# Altium project TYPEC_4KTransmitter-v1.0.PrjPcb (part 8 of 11)

## Sheet DRAM_LPDDR4_SHEET.SchDoc
size 420 x 297 mm; SheetNumber: 18; SheetTotal: 23
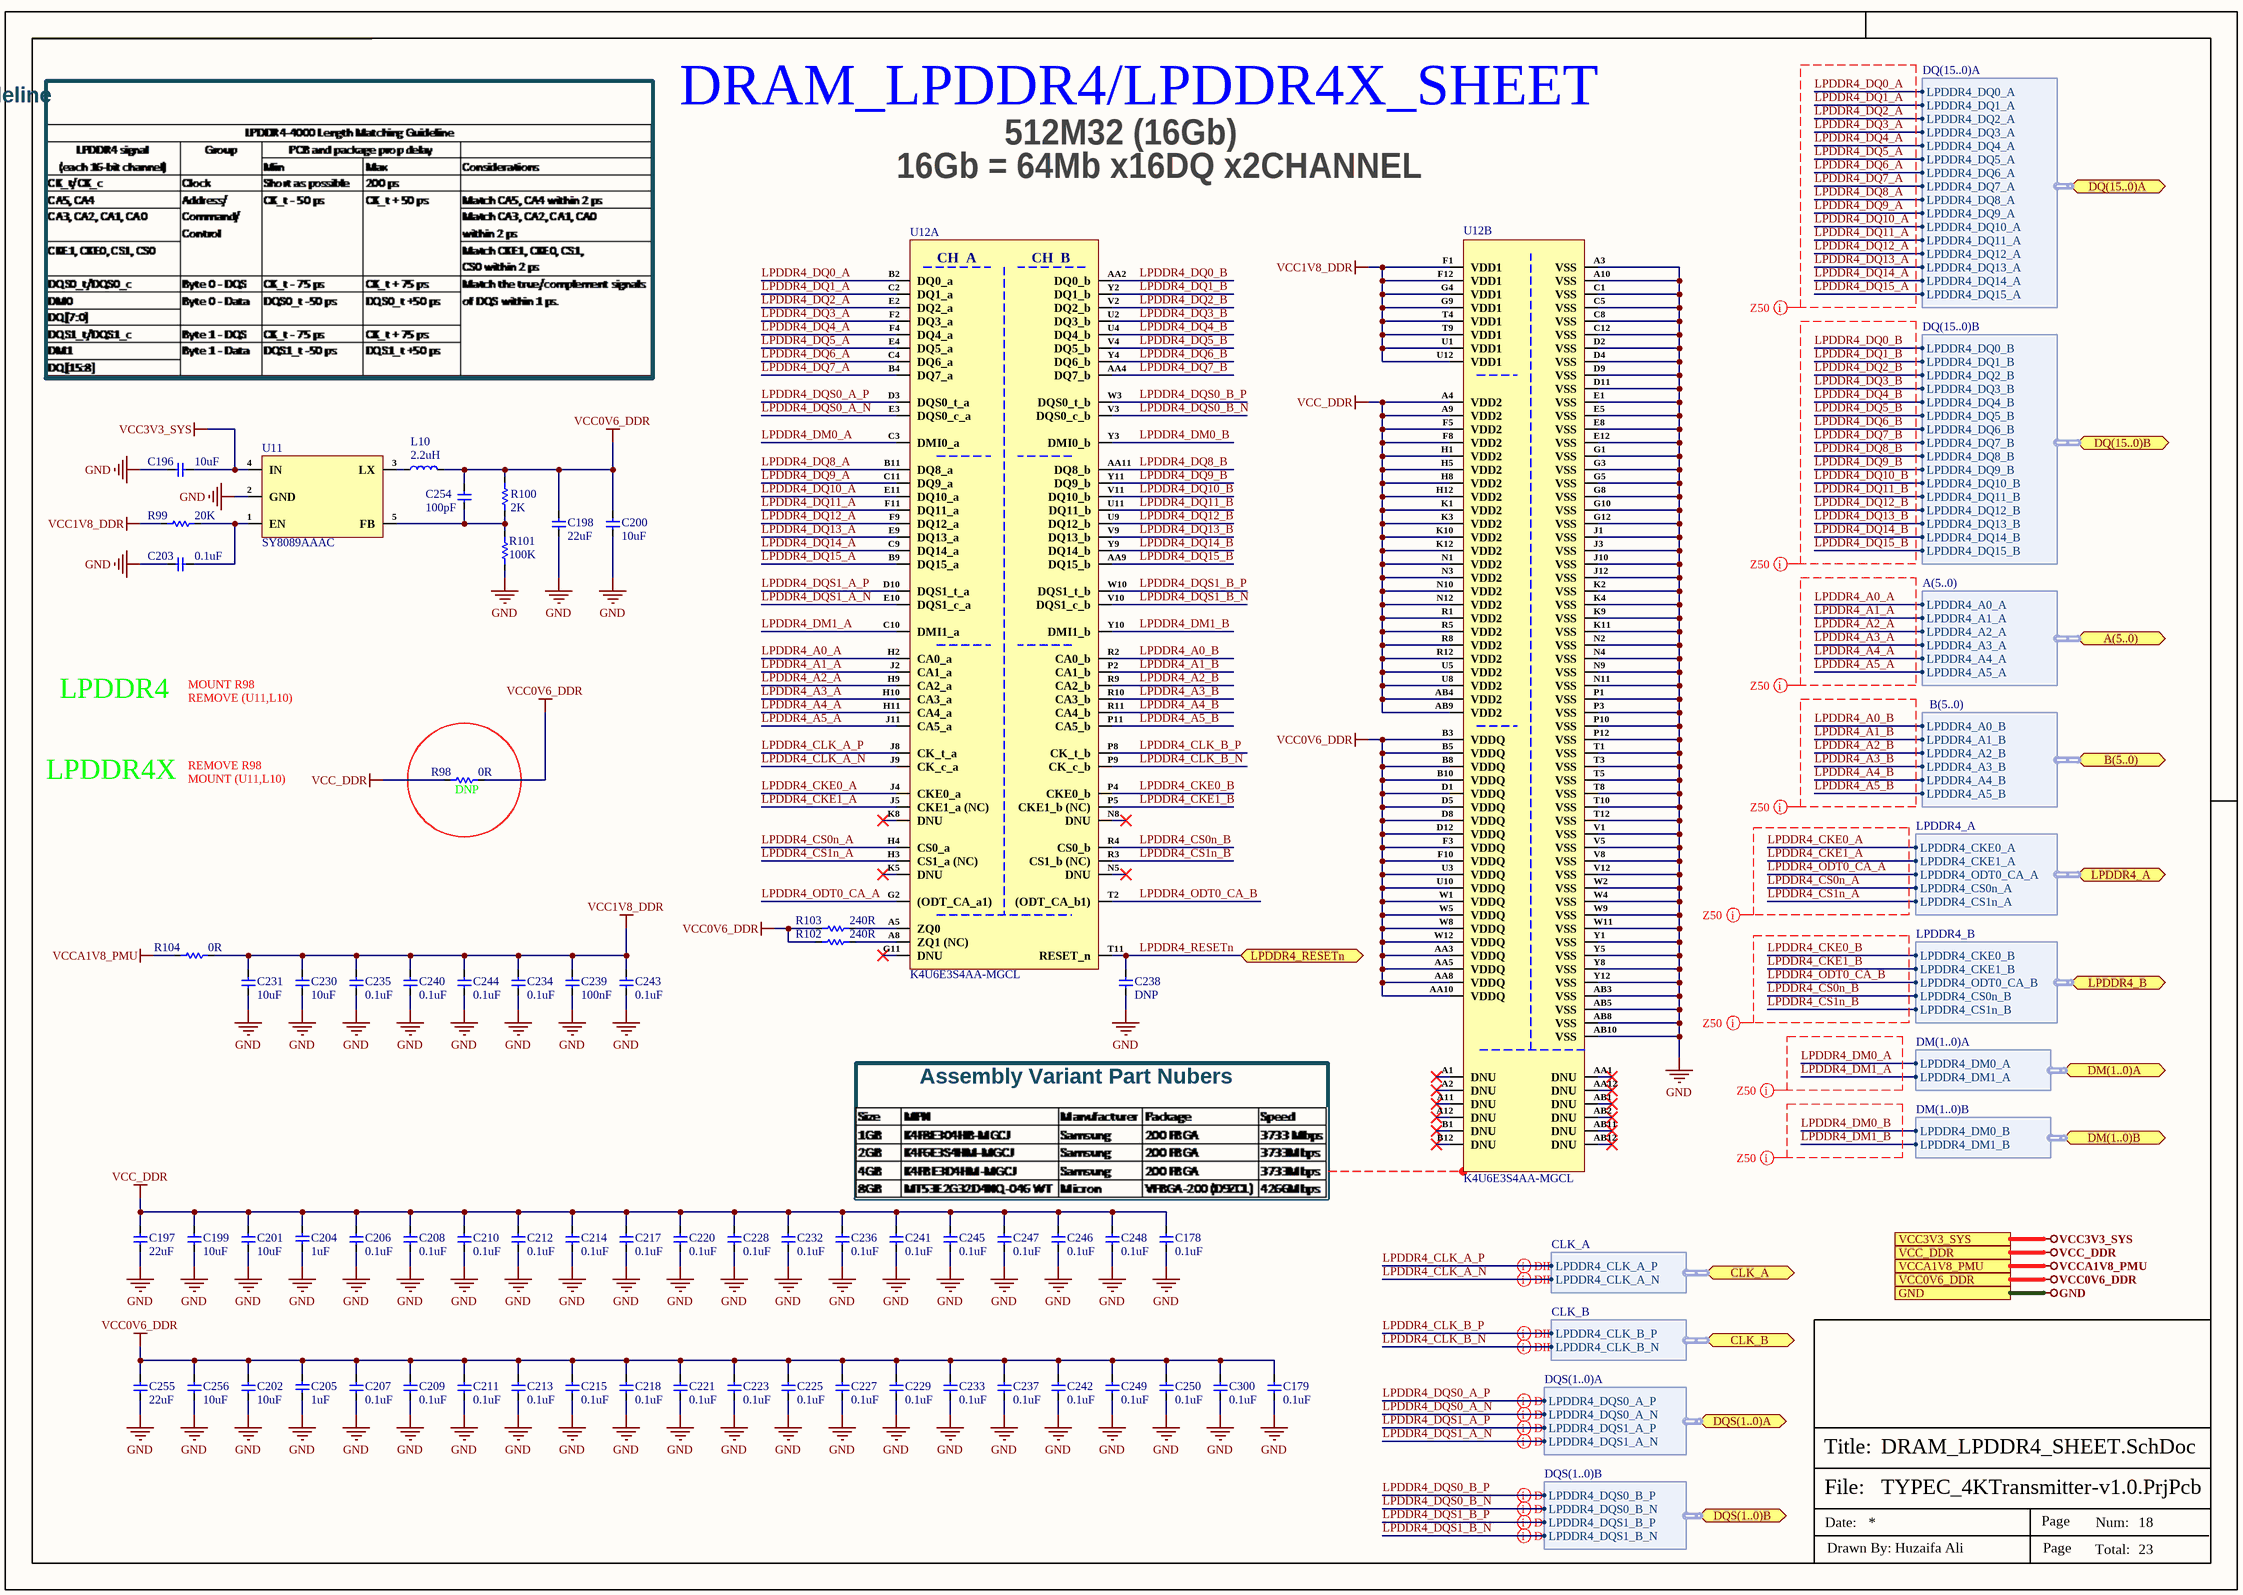
[diagram p18: DRAM_LPDDR4_SHEET.SchDoc]

### Parts
C178  0.1uF  [Cap-0402]
C179  0.1uF  [Cap-0402]
C196  10uF  [Cap-0603]
C197  22uF  [Cap-0603]
C198  22uF  [Cap-0603]
C199  10uF  [Cap-0603]
C200  10uF  [Cap-0603]
C201  10uF  [Cap-0603]
C202  10uF  [Cap-0402]
C203  0.1uF  [Cap-0402]
C204  1uF  [Cap-0402]
C205  1uF  [Cap-0402]
C206  0.1uF  [Cap-0402]
C207  0.1uF  [Cap-0402]
C208  0.1uF  [Cap-0402]
C209  0.1uF  [Cap-0402]
C210  0.1uF  [Cap-0402]
C211  0.1uF  [Cap-0402]
C212  0.1uF  [Cap-0402]
C213  0.1uF  [Cap-0402]
C214  0.1uF  [Cap-0402]
C215  0.1uF  [Cap-0402]
C217  0.1uF  [Cap-0402]
C218  0.1uF  [Cap-0402]
C220  0.1uF  [Cap-0402]
C221  0.1uF  [Cap-0402]
C223  0.1uF  [Cap-0402]
C225  0.1uF  [Cap-0402]
C227  0.1uF  [Cap-0402]
C228  0.1uF  [Cap-0402]
C229  0.1uF  [Cap-0402]
C230  10uF  [Cap-0603]
C231  10uF  [Cap-0603]
C232  0.1uF  [Cap-0402]
C233  0.1uF  [Cap-0402]
C234  0.1uF  [Cap-0402]
C235  0.1uF  [Cap-0402]
C236  0.1uF  [Cap-0402]
C237  0.1uF  [Cap-0402]
C238  DNP  [Cap-0402]
C239  100nF  [CAP-0201]
C240  0.1uF  [Cap-0402]
C241  0.1uF  [Cap-0402]
C242  0.1uF  [Cap-0402]
C243  0.1uF  [Cap-0402]
C244  0.1uF  [Cap-0402]
C245  0.1uF  [Cap-0402]
C246  0.1uF  [Cap-0402]
C247  0.1uF  [Cap-0402]
C248  0.1uF  [Cap-0402]
C249  0.1uF  [Cap-0402]
C250  0.1uF  [Cap-0402]
C254  100pF  [Cap-0402]
C255  22uF  [Cap-0603]
C256  10uF  [Cap-0402]
C300  0.1uF  [Cap-0402]
L10  2.2uH  [WPN4020H2R2MT_]
R98  DNP  [Res-0603]
R99  20K  [Res-0402]
R100  2K  [Res-0402]
R101  100K  [Res-0402]
R102  240R  [Res-0402]
R103  240R  [Res-0402]
R104  0R  [Res-0603]
U11  SY8089AAAC  [SOT-23-5]
U12  K4U6E3S4AA-MGCL  [200-WFBGA (10x15)]  (parts A,B of 2)

### Ports
A(5..0) (bidir, harness A(5..0), see RK3566_DDR-PHY_SHEET[4D]), B(5..0) (bidir, harness B(5..0), see RK3566_DDR-PHY_SHEET[5D]), CLK_A (bidir, harness CLK_A, see RK3566_DDR-PHY_SHEET[4D]), CLK_B (bidir, harness CLK_B, see RK3566_DDR-PHY_SHEET[5D]), DM(1..0)A (bidir, harness DM(1..0)A, see RK3566_DDR-PHY_SHEET[1C]), DM(1..0)B (bidir, harness DM(1..0)B, see RK3566_DDR-PHY_SHEET[3C]), DQ(15..0)A (bidir, harness DQ(15..0)A, see RK3566_DDR-PHY_SHEET[1D]), DQ(15..0)B (bidir, harness DQ(15..0)B, see RK3566_DDR-PHY_SHEET[3D]), DQS(1..0)A (bidir, harness DQS(1..0)A, see RK3566_DDR-PHY_SHEET[4D]), DQS(1..0)B (bidir, harness DQS(1..0)B, see RK3566_DDR-PHY_SHEET[5D]), GND (see eMMC_SPI-FLASH_SHEET[1D], HDMI2.0_SHEET[3D], POWER_LDO_SHEET[3D], POWER_OTHER_SHEET[3C], POWER_PMIC_RK809_CODEC[3C], POWER_PMIC_RK809_DC DC[3D], POWER_PMIC_RK809_LDO[4C], POWER_PMIC_RK809_MGM[3D], RK3566_AUDIO_SHEET[3C], RK3566_DDR-PHY_SHEET[5D], RK3566_FLASH-SD_SHEET[4C], RK3566_OSC_PMUIO_SHEET[5D], RK3566_POWER_SHEET[3D], RK3566_SARADC_GPIO[3D], RK3566_USB_PCIe_SHEET[3D], RK3566_VI_SHEET[3D], RK3566_VO_SHEET_1[3C], RK3566_VO_SHEET_2[4C], TYPE-C_INTERFACE_SHEET[3D], TYPE-C_TO_MIPI-CSI_SHEET[5D], USB2.0_SHEET[3D], WIFI-6_SHEET[3D]), LPDDR4_A (bidir, harness LPDDR4_A, see RK3566_DDR-PHY_SHEET[4D]), LPDDR4_B (bidir, harness LPDDR4_B, see RK3566_DDR-PHY_SHEET[5D]), LPDDR4_RESETn (bidir, see RK3566_DDR-PHY_SHEET[5B]), VCC0V6_DDR (see RK3566_DDR-PHY_SHEET[5D]), VCC3V3_SYS (see POWER_LDO_SHEET[3D], POWER_OTHER_SHEET[3C], POWER_PMIC_RK809_DC DC[3D], POWER_PMIC_RK809_LDO[4C], POWER_PMIC_RK809_MGM[3D], RK3566_SARADC_GPIO[3D], TYPE-C_TO_MIPI-CSI_SHEET[5D], WIFI-6_SHEET[3D]), VCC_DDR (see POWER_PMIC_RK809_DC DC[3D], RK3566_DDR-PHY_SHEET[5D]), VCCA1V8_PMU (see POWER_PMIC_RK809_LDO[4C], RK3566_OSC_PMUIO_SHEET[5D])

### Harnesses
DQ(15..0)A: LPDDR4_DQ0_A, LPDDR4_DQ1_A, LPDDR4_DQ2_A, LPDDR4_DQ3_A, LPDDR4_DQ4_A, LPDDR4_DQ5_A, LPDDR4_DQ6_A, LPDDR4_DQ7_A, LPDDR4_DQ8_A, LPDDR4_DQ9_A, LPDDR4_DQ10_A, LPDDR4_DQ11_A, LPDDR4_DQ12_A, LPDDR4_DQ13_A, LPDDR4_DQ14_A, LPDDR4_DQ15_A
DQ(15..0)B: LPDDR4_DQ0_B, LPDDR4_DQ1_B, LPDDR4_DQ2_B, LPDDR4_DQ3_B, LPDDR4_DQ4_B, LPDDR4_DQ5_B, LPDDR4_DQ6_B, LPDDR4_DQ7_B, LPDDR4_DQ8_B, LPDDR4_DQ9_B, LPDDR4_DQ10_B, LPDDR4_DQ11_B, LPDDR4_DQ12_B, LPDDR4_DQ13_B, LPDDR4_DQ14_B, LPDDR4_DQ15_B
DM(1..0)A: LPDDR4_DM0_A, LPDDR4_DM1_A
DM(1..0)B: LPDDR4_DM0_B, LPDDR4_DM1_B
DQS(1..0)A: LPDDR4_DQS0_A_P, LPDDR4_DQS0_A_N, LPDDR4_DQS1_A_P, LPDDR4_DQS1_A_N
DQS(1..0)B: LPDDR4_DQS0_B_P, LPDDR4_DQS0_B_N, LPDDR4_DQS1_B_P, LPDDR4_DQS1_B_N
CLK_B: LPDDR4_CLK_B_P, LPDDR4_CLK_B_N
CLK_A: LPDDR4_CLK_A_P, LPDDR4_CLK_A_N
A(5..0): LPDDR4_A3_A, LPDDR4_A5_A, LPDDR4_A1_A, LPDDR4_A0_A, LPDDR4_A2_A, LPDDR4_A4_A
B(5..0): LPDDR4_A3_B, LPDDR4_A5_B, LPDDR4_A1_B, LPDDR4_A0_B, LPDDR4_A2_B, LPDDR4_A4_B
LPDDR4_A: LPDDR4_CKE1_A, LPDDR4_ODT0_CA_A, LPDDR4_CKE0_A, LPDDR4_CS0n_A, LPDDR4_CS1n_A
LPDDR4_B: LPDDR4_ODT0_CA_B, LPDDR4_CKE0_B, LPDDR4_CKE1_B, LPDDR4_CS1n_B, LPDDR4_CS0n_B

### Nets
GND: C178.1 C179.1 C196.1 C197.1 C198.1 C199.1 C200.1 C201.1 C202.1 C203.1 C204.2 C205.2 C206.1 C207.1 C208.1 C209.1 C210.1 C211.1 C212.1 C213.1 C214.1 C215.1 C217.1 C218.1 C220.1 C221.1 C223.1 C225.1 C227.1 C228.1 C229.1 C230.1 C231.1 C232.1 C233.1 C234.1 C235.1 C236.1 C237.1 C238.1 C239.1 C240.1 C241.1 C242.1 C243.1 C244.1 C245.1 C246.1 C247.1 C248.1 C249.1 C250.1 C255.1 C256.1 C300.1 R101.1 U11.2(GND) U12.A3(VSS) U12.A10(VSS) U12.AB3(VSS) U12.AB5(VSS) U12.AB8(VSS) U12.AB10(VSS) U12.C1(VSS) U12.C5(VSS) U12.C8(VSS) U12.C12(VSS) U12.D2(VSS) U12.D4(VSS) U12.D9(VSS) U12.D11(VSS) U12.E1(VSS) U12.E5(VSS) U12.E8(VSS) U12.E12(VSS) U12.G1(VSS) U12.G3(VSS) U12.G5(VSS) U12.G8(VSS) U12.G10(VSS) U12.G12(VSS) U12.J1(VSS) U12.J3(VSS) U12.J10(VSS) U12.J12(VSS) U12.K2(VSS) U12.K4(VSS) U12.K9(VSS) U12.K11(VSS) U12.N2(VSS) U12.N4(VSS) U12.N9(VSS) U12.N11(VSS) U12.P1(VSS) U12.P3(VSS) U12.P10(VSS) U12.P12(VSS) U12.T1(VSS) U12.T3(VSS) U12.T5(VSS) U12.T8(VSS) U12.T10(VSS) U12.T12(VSS) U12.V1(VSS) U12.V5(VSS) U12.V8(VSS) U12.V12(VSS) U12.W2(VSS) U12.W4(VSS) U12.W9(VSS) U12.W11(VSS) U12.Y1(VSS) U12.Y5(VSS) U12.Y8(VSS) U12.Y12(VSS) ; port GND
VCC0V6_DDR: C179.2 C198.2 C200.2 C202.2 C205.1 C207.2 C209.2 C211.2 C213.2 C215.2 C218.2 C221.2 C223.2 C225.2 C227.2 C229.2 C233.2 C237.2 C242.2 C249.2 C250.2 C254.2 C255.2 C256.2 C300.2 L10.2 R98.1 R100.2 R102.2 R103.2 U12.AA3(VDDQ) U12.AA5(VDDQ) U12.AA8(VDDQ) U12.AA10(VDDQ) U12.B3(VDDQ) U12.B5(VDDQ) U12.B8(VDDQ) U12.B10(VDDQ) U12.D1(VDDQ) U12.D5(VDDQ) U12.D8(VDDQ) U12.D12(VDDQ) U12.F3(VDDQ) U12.F10(VDDQ) U12.U3(VDDQ) U12.U10(VDDQ) U12.W1(VDDQ) U12.W5(VDDQ) U12.W8(VDDQ) U12.W12(VDDQ) ; port VCC0V6_DDR
VCC1V8_DDR: C230.2 C231.2 C234.2 C235.2 C239.2 C240.2 C243.2 C244.2 R99.2 R104.2 U12.F1(VDD1) U12.F12(VDD1) U12.G4(VDD1) U12.G9(VDD1) U12.T4(VDD1) U12.T9(VDD1) U12.U1(VDD1) U12.U12(VDD1)
VCC3V3_SYS: C196.2 U11.4(IN) ; port VCC3V3_SYS
VCC_DDR: C178.2 C197.2 C199.2 C201.2 C204.1 C206.2 C208.2 C210.2 C212.2 C214.2 C217.2 C220.2 C228.2 C232.2 C236.2 C241.2 C245.2 C246.2 C247.2 C248.2 R98.2 U12.A4(VDD2) U12.A9(VDD2) U12.AB4(VDD2) U12.AB9(VDD2) U12.F5(VDD2) U12.F8(VDD2) U12.H1(VDD2) U12.H5(VDD2) U12.H8(VDD2) U12.H12(VDD2) U12.K1(VDD2) U12.K3(VDD2) U12.K10(VDD2) U12.K12(VDD2) U12.N1(VDD2) U12.N3(VDD2) U12.N10(VDD2) U12.N12(VDD2) U12.R1(VDD2) U12.R5(VDD2) U12.R8(VDD2) U12.R12(VDD2) U12.U5(VDD2) U12.U8(VDD2) ; port VCC_DDR
VCCA1V8_PMU: R104.1 ; port VCCA1V8_PMU
LPDDR4_A0_A: U12.H2(CA0_a) ; port A(5..0).LPDDR4_A0_A
LPDDR4_A0_B: U12.R2(CA0_b) ; port B(5..0).LPDDR4_A0_B
LPDDR4_A1_A: U12.J2(CA1_a) ; port A(5..0).LPDDR4_A1_A
LPDDR4_A1_B: U12.P2(CA1_b) ; port B(5..0).LPDDR4_A1_B
LPDDR4_A2_A: U12.H9(CA2_a) ; port A(5..0).LPDDR4_A2_A
LPDDR4_A2_B: U12.R9(CA2_b) ; port B(5..0).LPDDR4_A2_B
LPDDR4_A3_A: U12.H10(CA3_a) ; port A(5..0).LPDDR4_A3_A
LPDDR4_A3_B: U12.R10(CA3_b) ; port B(5..0).LPDDR4_A3_B
LPDDR4_A4_A: U12.H11(CA4_a) ; port A(5..0).LPDDR4_A4_A
LPDDR4_A4_B: U12.R11(CA4_b) ; port B(5..0).LPDDR4_A4_B
LPDDR4_A5_A: U12.J11(CA5_a) ; port A(5..0).LPDDR4_A5_A
LPDDR4_A5_B: U12.P11(CA5_b) ; port B(5..0).LPDDR4_A5_B
LPDDR4_CKE0_A: U12.J4(CKE0_a) ; port LPDDR4_A.LPDDR4_CKE0_A
LPDDR4_CKE0_B: U12.P4(CKE0_b) ; port LPDDR4_B.LPDDR4_CKE0_B
LPDDR4_CKE1_A: U12.J5(CKE1_a_(NC)) ; port LPDDR4_A.LPDDR4_CKE1_A
LPDDR4_CKE1_B: U12.P5(CKE1_b_(NC)) ; port LPDDR4_B.LPDDR4_CKE1_B
LPDDR4_CLK_A_N: U12.J9(CK_c_a) ; port CLK_A.LPDDR4_CLK_A_N
LPDDR4_CLK_A_P: U12.J8(CK_t_a) ; port CLK_A.LPDDR4_CLK_A_P
LPDDR4_CLK_B_N: U12.P9(CK_c_b) ; port CLK_B.LPDDR4_CLK_B_N
LPDDR4_CLK_B_P: U12.P8(CK_t_b) ; port CLK_B.LPDDR4_CLK_B_P
LPDDR4_CS0n_A: U12.H4(CS0_a) ; port LPDDR4_A.LPDDR4_CS0n_A
LPDDR4_CS0n_B: U12.R4(CS0_b) ; port LPDDR4_B.LPDDR4_CS0n_B
LPDDR4_CS1n_A: U12.H3(CS1_a_(NC)) ; port LPDDR4_A.LPDDR4_CS1n_A
LPDDR4_CS1n_B: U12.R3(CS1_b_(NC)) ; port LPDDR4_B.LPDDR4_CS1n_B
LPDDR4_DM0_A: U12.C3(DMI0_a) ; port DM(1..0)A.LPDDR4_DM0_A
LPDDR4_DM0_B: U12.Y3(DMI0_b) ; port DM(1..0)B.LPDDR4_DM0_B
LPDDR4_DM1_A: U12.C10(DMI1_a) ; port DM(1..0)A.LPDDR4_DM1_A
LPDDR4_DM1_B: U12.Y10(DMI1_b) ; port DM(1..0)B.LPDDR4_DM1_B
LPDDR4_DQ0_A: U12.B2(DQ0_a) ; port DQ(15..0)A.LPDDR4_DQ0_A
LPDDR4_DQ0_B: U12.AA2(DQ0_b) ; port DQ(15..0)B.LPDDR4_DQ0_B
LPDDR4_DQ1_A: U12.C2(DQ1_a) ; port DQ(15..0)A.LPDDR4_DQ1_A
LPDDR4_DQ1_B: U12.Y2(DQ1_b) ; port DQ(15..0)B.LPDDR4_DQ1_B
LPDDR4_DQ2_A: U12.E2(DQ2_a) ; port DQ(15..0)A.LPDDR4_DQ2_A
LPDDR4_DQ2_B: U12.V2(DQ2_b) ; port DQ(15..0)B.LPDDR4_DQ2_B
LPDDR4_DQ3_A: U12.F2(DQ3_a) ; port DQ(15..0)A.LPDDR4_DQ3_A
LPDDR4_DQ3_B: U12.U2(DQ3_b) ; port DQ(15..0)B.LPDDR4_DQ3_B
LPDDR4_DQ4_A: U12.F4(DQ4_a) ; port DQ(15..0)A.LPDDR4_DQ4_A
LPDDR4_DQ4_B: U12.U4(DQ4_b) ; port DQ(15..0)B.LPDDR4_DQ4_B
LPDDR4_DQ5_A: U12.E4(DQ5_a) ; port DQ(15..0)A.LPDDR4_DQ5_A
LPDDR4_DQ5_B: U12.V4(DQ5_b) ; port DQ(15..0)B.LPDDR4_DQ5_B
LPDDR4_DQ6_A: U12.C4(DQ6_a) ; port DQ(15..0)A.LPDDR4_DQ6_A
LPDDR4_DQ6_B: U12.Y4(DQ6_b) ; port DQ(15..0)B.LPDDR4_DQ6_B
LPDDR4_DQ7_A: U12.B4(DQ7_a) ; port DQ(15..0)A.LPDDR4_DQ7_A
LPDDR4_DQ7_B: U12.AA4(DQ7_b) ; port DQ(15..0)B.LPDDR4_DQ7_B
LPDDR4_DQ8_A: U12.B11(DQ8_a) ; port DQ(15..0)A.LPDDR4_DQ8_A
LPDDR4_DQ8_B: U12.AA11(DQ8_b) ; port DQ(15..0)B.LPDDR4_DQ8_B
LPDDR4_DQ9_A: U12.C11(DQ9_a) ; port DQ(15..0)A.LPDDR4_DQ9_A
LPDDR4_DQ9_B: U12.Y11(DQ9_b) ; port DQ(15..0)B.LPDDR4_DQ9_B
LPDDR4_DQ10_A: U12.E11(DQ10_a) ; port DQ(15..0)A.LPDDR4_DQ10_A
LPDDR4_DQ10_B: U12.V11(DQ10_b) ; port DQ(15..0)B.LPDDR4_DQ10_B
LPDDR4_DQ11_A: U12.F11(DQ11_a) ; port DQ(15..0)A.LPDDR4_DQ11_A
LPDDR4_DQ11_B: U12.U11(DQ11_b) ; port DQ(15..0)B.LPDDR4_DQ11_B
LPDDR4_DQ12_A: U12.F9(DQ12_a) ; port DQ(15..0)A.LPDDR4_DQ12_A
LPDDR4_DQ12_B: U12.U9(DQ12_b) ; port DQ(15..0)B.LPDDR4_DQ12_B
LPDDR4_DQ13_A: U12.E9(DQ13_a) ; port DQ(15..0)A.LPDDR4_DQ13_A
LPDDR4_DQ13_B: U12.V9(DQ13_b) ; port DQ(15..0)B.LPDDR4_DQ13_B
LPDDR4_DQ14_A: U12.C9(DQ14_a) ; port DQ(15..0)A.LPDDR4_DQ14_A
LPDDR4_DQ14_B: U12.Y9(DQ14_b) ; port DQ(15..0)B.LPDDR4_DQ14_B
LPDDR4_DQ15_A: U12.B9(DQ15_a) ; port DQ(15..0)A.LPDDR4_DQ15_A
LPDDR4_DQ15_B: U12.AA9(DQ15_b) ; port DQ(15..0)B.LPDDR4_DQ15_B
LPDDR4_DQS0_A_N: U12.E3(DQS0_c_a) ; port DQS(1..0)A.LPDDR4_DQS0_A_N
LPDDR4_DQS0_A_P: U12.D3(DQS0_t_a) ; port DQS(1..0)A.LPDDR4_DQS0_A_P
LPDDR4_DQS0_B_N: U12.V3(DQS0_c_b) ; port DQS(1..0)B.LPDDR4_DQS0_B_N
LPDDR4_DQS0_B_P: U12.W3(DQS0_t_b) ; port DQS(1..0)B.LPDDR4_DQS0_B_P
LPDDR4_DQS1_A_N: U12.E10(DQS1_c_a) ; port DQS(1..0)A.LPDDR4_DQS1_A_N
LPDDR4_DQS1_A_P: U12.D10(DQS1_t_a) ; port DQS(1..0)A.LPDDR4_DQS1_A_P
LPDDR4_DQS1_B_N: U12.V10(DQS1_c_b) ; port DQS(1..0)B.LPDDR4_DQS1_B_N
LPDDR4_DQS1_B_P: U12.W10(DQS1_t_b) ; port DQS(1..0)B.LPDDR4_DQS1_B_P
LPDDR4_ODT0_CA_A: U12.G2((ODT_CA_a1)) ; port LPDDR4_A.LPDDR4_ODT0_CA_A
LPDDR4_ODT0_CA_B: U12.T2((ODT_CA_b1)) ; port LPDDR4_B.LPDDR4_ODT0_CA_B
LPDDR4_RESETn: C238.2 U12.T11(RESET_n) ; port LPDDR4_RESETn
NetC203_2: C203.2 R99.1 U11.1(EN)
NetC254_1: C254.1 R100.1 R101.2 U11.5(FB)
NetL10_1: L10.1 U11.3(LX)
NetR102_1: R102.1 U12.A8(ZQ1_(NC))
NetR103_1: R103.1 U12.A5(ZQ0)

Not connected (* = marked no-connect by the designer): U12 A1(DNU)* A2(DNU)* A11(DNU)* A12(DNU)* AA1(DNU)* AA12(DNU)* AB1(DNU)* AB2(DNU)* AB11(DNU)* AB12(DNU)* B1(DNU)* B12(DNU)* G11(DNU)* K5(DNU)* K8(DNU)* N5(DNU)* N8(DNU)*

### Layout directives
net class 50OHM_DDR: LPDDR4_A0_A, LPDDR4_A0_B, LPDDR4_A1_A, LPDDR4_A1_B, LPDDR4_A2_A, LPDDR4_A2_B, LPDDR4_A3_A, LPDDR4_A3_B, LPDDR4_A4_A, LPDDR4_A4_B, LPDDR4_A5_A, LPDDR4_A5_B, LPDDR4_CKE0_A, LPDDR4_CKE0_B, LPDDR4_CKE1_A, LPDDR4_CKE1_B, LPDDR4_CS0n_A, LPDDR4_CS0n_B, LPDDR4_CS1n_A, LPDDR4_CS1n_B, LPDDR4_DM0_A, LPDDR4_DM0_B, LPDDR4_DM1_A, LPDDR4_DM1_B, LPDDR4_DQ0_A, LPDDR4_DQ0_B, LPDDR4_DQ1_A, LPDDR4_DQ1_B, LPDDR4_DQ2_A, LPDDR4_DQ2_B, LPDDR4_DQ3_A, LPDDR4_DQ3_B, LPDDR4_DQ4_A, LPDDR4_DQ4_B, LPDDR4_DQ5_A, LPDDR4_DQ5_B, LPDDR4_DQ6_A, LPDDR4_DQ6_B, LPDDR4_DQ7_A, LPDDR4_DQ7_B, LPDDR4_DQ8_A, LPDDR4_DQ8_B, LPDDR4_DQ9_A, LPDDR4_DQ9_B, LPDDR4_DQ10_A, LPDDR4_DQ10_B, LPDDR4_DQ11_A, LPDDR4_DQ11_B, LPDDR4_DQ12_A, LPDDR4_DQ12_B, LPDDR4_DQ13_A, LPDDR4_DQ13_B, LPDDR4_DQ14_A, LPDDR4_DQ14_B, LPDDR4_DQ15_A, LPDDR4_DQ15_B, LPDDR4_ODT0_CA_A, LPDDR4_ODT0_CA_B
differential pair; differential pair class 100OHM_DDR_DQS: LPDDR4_DQS0_A_N, LPDDR4_DQS0_A_P, LPDDR4_DQS0_B_N, LPDDR4_DQS0_B_P, LPDDR4_DQS1_A_N, LPDDR4_DQS1_A_P, LPDDR4_DQS1_B_N, LPDDR4_DQS1_B_P
differential pair; differential pair class 100OHM_DDR_CLK: LPDDR4_CLK_A_N, LPDDR4_CLK_A_P, LPDDR4_CLK_B_N, LPDDR4_CLK_B_P

### Notes on the sheet
- PCB Layout Length Matching Guideline
- 512M32 (16Gb)
- DRAM_LPDDR4/LPDDR4X_SHEET
- 16Gb = 64Mb x16DQ x2CHANNEL
- LPDDR4
- REMOVE (U11,L10)
- MOUNT R98
- LPDDR4X
- MOUNT (U11,L10)
- REMOVE R98
- (near R98) 0R
- Assembly Variant Part Nubers
- File:
- Title:
- Date:
- Page
- Num:
- Total:
- Drawn By: Huzaifa Ali
- (in symbol K4U6E3S4AA-MGCL, part A) CH  A; CH  B

### Library data of the parts
C178 C179 C203 C206-C215 C217 C218 C220 C221 C223 C225 C227-C229 C232-C237 C240-C250 C300 = CC0402KRX5R6BB104: CAP CER 0.1UF 10V X5R 0402; Manufacturer: Yageo; Capacitance: 100nF; Tolerance: 10%; Dissipation Factor: 5%; Insulation Resistance: 10GR; Item Type: Capacitor; Supplier 1: Digi-Key; Manufacturer Part Number: CC0402KRX5R6BB104; RoHS: Yes; Category: Ceramic Capacitors; Stock 1: 6385580; Pricing 1: 1=0.10000, 10=0.02700, 50=0.01500, 100=0.01220, 500=0.00874, 1000=0.00687, 2500=0.00625, 5000=0.00575 (USD); Mount: Surface Mount; Case/Package: 0402; Number of Pins: 2; Case Code (Imperial): 0402; Case Code (Metric): 1005; Min Operating Temperature: -55°C; Max Operating Temperature: 85°C; Dielectric: X5R; Packaging: Tape and Reel; Voltage Rating: 10V; Package Quantity: 1; Termination: SMD/SMT; Voltage Rating (DC): 10V; Series: CC; Length: 1mm; Width: 0.02inch; Height: 0.5mm; Depth: 0.5mm; Thickness: 0.022inch; Radiation Hardening: No; RoHS Compliant: Yes; REACH SVHC: No SVHC; Lead Free: Lead Free; Halogen Free: Halogen Free; ComponentLink1URL: https://datasheet.ciiva.com/144/mlccorderingcode-144029.pdf?src-supplier=Digi-Key; ComponentLink1Description: https://datasheet.ciiva.com/144/mlccorderingcode-144029.pdf?src-supplier=Digi-Key; ComponentLink2URL: https://datasheet.ciiva.com/144/mlccorderingcode-144028.pdf?src-supplier=Digi-Key; ComponentLink2Description: https://datasheet.ciiva.com/144/mlccorderingcode-144028.pdf?src-supplier=Digi-Key; ComponentLink3URL: https://datasheet.ciiva.com/144/mlccorderingcode-144030.pdf?src-supplier=Digi-Key; ComponentLink3Description: https://datasheet.ciiva.com/144/mlccorderingcode-144030.pdf?src-supplier=Digi-Key; ComponentLink4URL: https://datasheet.ciiva.com/7978/1359354-7978091.pdf?src-supplier=Element14; ComponentLink4Description: https://datasheet.ciiva.com/7978/1359354-7978091.pdf?src-supplier=Element14; ComponentLink5URL: https://datasheet.ciiva.com/11587/upy-gphc-x5r-4v-to-50v-12-11587302.pdf?src-supplier=Avnet; ComponentLink5Description: https://datasheet.ciiva.com/11587/upy-gphc-x5r-4v-to-50v-12-11587302.pdf?src-supplier=Avnet; Supplier Part Number 1: 311-1336-1-ND; LCSC Part Number: C129131
C196 C199-C201 C230 C231 = CC0603KRX5R6BB106: CAP CER 10UF 10V X5R 0603; Manufacturer: Yageo; Tolerance: 10%; Item Type: Capacitor; Supplier 1: Digi-Key; Manufacturer Part Number: CC0603KRX5R6BB106; RoHS: Yes; Category: Ceramic Capacitors; Stock 1: 187515; Pricing 1: 1=0.24000, 10=0.16300, 50=0.09780, 100=0.08260, 500=0.05654, 1000=0.05001 (USD); Mount: Surface Mount; Case/Package: 0603; Case Code (Metric): 1608; Case Code (Imperial): 0603; Weight: 7.1E-05oz; Min Operating Temperature: -55°C; Max Operating Temperature: 85°C; Capacitance: 10uF; Packaging: Tape and Reel; Dielectric: X5R; Voltage Rating: 10V; Termination: SMD/SMT; Resistor Type: Ceramic; Voltage Rating (DC): 10V; Package Quantity: 4000; Length: 0.063inch; Width: 0.031inch; Thickness: 0.035inch; Depth: 0.8mm; Lead Free: Lead Free; Halogen Free: Halogen Free; RoHS Compliant: Yes; ComponentLink1URL: http://www.mouser.com/ds/2/447/Yageo_UPY-GP_NP0_16V-to-50V_9-358835.pdf?src-supplier=Mouser; ComponentLink1Description: http://www.mouser.com/ds/2/447/Yageo_UPY-GP_NP0_16V-to-50V_9-358835.pdf?src-supplier=Mouser; ComponentLink2URL: http://www.yageo.com/documents/recent/UPY-GPHC_X5R_4V-to-50V_25.pdf?src-supplier=Digi-Key; ComponentLink2Description: http://www.yageo.com/documents/recent/UPY-GPHC_X5R_4V-to-50V_25.pdf?src-supplier=Digi-Key; Supplier Part Number 1: 311-1782-1-ND; LCSC Part Number: C326057
C197 C198 C255 = CC0603MRX5R6BB226: CAP CER 22UF 10V X5R 0603; Manufacturer: Yageo; Tolerance: 20%; Item Type: Capacitor; Supplier 1: Digi-Key; Manufacturer Part Number: CC0603MRX5R6BB226; RoHS: Yes; Category: Ceramic Capacitors; Stock 1: 19628; Pricing 1: 1=0.68000, 10=0.48000, 50=0.36300, 100=0.31610, 500=0.23416, 1000=0.19903 (USD); Mount: Surface Mount; Case/Package: 0603; Case Code (Metric): 1608; Case Code (Imperial): 0603; Weight: 7.1E-05oz; Min Operating Temperature: -55°C; Max Operating Temperature: 85°C; Capacitance: 22uF; Packaging: Tape and Reel; Dielectric: X5R; Voltage Rating: 10V; Termination: SMD/SMT; Voltage Rating (DC): 10V; Package Quantity: 4000; Length: 0.063inch; Width: 0.8mm; Thickness: 0.035inch; Lead Free: Lead Free; Halogen Free: Halogen Free; RoHS Compliant: Yes; ComponentLink1URL: http://www.mouser.com/ds/2/447/Yageo_UPY-GP_NP0_16V-to-50V_9-358835.pdf?src-supplier=Mouser; ComponentLink1Description: http://www.mouser.com/ds/2/447/Yageo_UPY-GP_NP0_16V-to-50V_9-358835.pdf?src-supplier=Mouser; ComponentLink2URL: http://www.yageo.com/documents/recent/UPY-GPHC_X5R_4V-to-50V_25.pdf?src-supplier=Digi-Key; ComponentLink2Description: http://www.yageo.com/documents/recent/UPY-GPHC_X5R_4V-to-50V_25.pdf?src-supplier=Digi-Key; Supplier Part Number 1: 311-1819-1-ND; LCSC Part Number: C109447; Height: 0.8mm
C202 C256 = CC0402MRX5R6BB106: CAP CER 10UF 10V X5R 0402; Manufacturer: Yageo; Tolerance: 20%; Item Type: Capacitor; Supplier 1: Future Electronics; Manufacturer Part Number: CC0402MRX5R6BB106; RoHS: Yes; Category: Ceramic Capacitors; Stock 1: 80000; Pricing 1: 10000=0.02650, 20000=0.02590, 30000=0.02550, 40000=0.02530, 50000=0.02450 (USD); Mount: Surface Mount; Case/Package: 0402; Case Code (Metric): 1005; Case Code (Imperial): 0402; Min Operating Temperature: -55°C; Max Operating Temperature: 85°C; Capacitance: 10uF; Packaging: Tape and Reel; Voltage Rating: 10V; RoHS Compliant: Yes; ComponentLink1URL: http://www.yageo.com/documents/recent/UPY-GPHC_X5R_4V-to-50V_25.pdf?src-supplier=Digi-Key; ComponentLink1Description: http://www.yageo.com/documents/recent/UPY-GPHC_X5R_4V-to-50V_25.pdf?src-supplier=Digi-Key; Supplier Part Number 1: 6097631; LCSC Part Number: C962143
C204 C205 = CC0402KRX5R6BB105: CAP CER 1UF 10V X5R 0402; Manufacturer: Yageo; Tolerance: 10%; Dissipation Factor: 15%; Item Type: Capacitor; Supplier 1: Mouser; Manufacturer Part Number: CC0402KRX5R6BB105; RoHS: Yes; Category: Ceramic Capacitors; Stock 1: 6711367; Pricing 1: 1=0.11000, 10=0.05500, 50=0.05500, 100=0.03300, 500=0.02700, 1000=0.02200, 2500=0.02100, 10000=0.01800 (USD); Mount: Surface Mount; Case/Package: 0402; Number of Pins: 2; Case Code (Metric): 1005; Case Code (Imperial): 0402; Min Operating Temperature: -55°C; Max Operating Temperature: 85°C; Capacitance: 1uF; Dielectric: X5R; Package Quantity: 1; Voltage Rating: 10V; Packaging: Tape and Reel; Voltage Rating (DC): 10V; Termination: SMD/SMT; Resistor Type: Ceramic; Series: CC; Construction: Flat; Length: 1mm; Width: 0.02inch; Height: 0.5mm; Thickness: 0.022inch; Depth: 0.5mm; Radiation Hardening: No; REACH SVHC: No SVHC; Lead Free: Lead Free; Halogen Free: Halogen Free; RoHS Compliant: Yes; ComponentLink1URL: https://datasheet.ciiva.com/176/upy-gphc-x5r-4v-to-50v-12-176704.pdf?src-supplier=Digi-Key; ComponentLink1Description: https://datasheet.ciiva.com/176/upy-gphc-x5r-4v-to-50v-12-176704.pdf?src-supplier=Digi-Key; ComponentLink2URL: https://datasheet.ciiva.com/176/mlccorderingcode-176705.pdf?src-supplier=Digi-Key; ComponentLink2Description: https://datasheet.ciiva.com/176/mlccorderingcode-176705.pdf?src-supplier=Digi-Key; ComponentLink3URL: https://datasheet.ciiva.com/176/mlccorderingcode-176706.pdf?src-supplier=Digi-Key; ComponentLink3Description: https://datasheet.ciiva.com/176/mlccorderingcode-176706.pdf?src-supplier=Digi-Key; Supplier Part Number 1: 603-CC402KRX5R6BB105; LCSC Part Number: C106254
C238 = GRM1555C1H102JA01D: CAP CER 1000PF 50V C0G/NP0 0402; Manufacturer: Murata; Material: Ceramic; Capacitance: 1nF; Tolerance: 5%; Dielectric: C0G; Insulation Resistance: 10GR; Temperature Coefficient: 30ppm/°C; Item Type: Capacitor; Supplier 1: Avnet; Manufacturer Part Number: GRM1555C1H102JA01D; RoHS: Yes; Category: Ceramic Capacitors; Stock 1: 800000; Pricing 1: 10000=0.00648, 20000=0.00613, 40000=0.00578, 60000=0.00543, 80000=0.00508, 100000=0.00473, 1000000=0.00438 (USD); Mount: Surface Mount; Case/Package: 0402; Number of Pins: 2; Case Code (Metric): 1005; Case Code (Imperial): 0402; Dielectric Material: Ceramic; Min Operating Temperature: -55°C; Max Operating Temperature: 125°C; Package Quantity: 1; Voltage Rating: 50V; Packaging: Tape and Reel; Voltage Rating (DC): 50V; Termination: SMD/SMT; Voltage: 50V; Series: GRM; Construction: Flat; Length: 1mm; Width: 0.5mm; Height: 0.5mm; Thickness: 0.022inch; Depth: 0.5mm; Size: 0.5mm; Radiation Hardening: No; Reach SVHC Compliant: Yes; Lead Free: Lead Free; RoHS Compliant: Yes; ComponentLink1URL: https://datasheet.ciiva.com/34302/1855908-34302849.pdf?src-supplier=Jameco; ComponentLink1Description: https://datasheet.ciiva.com/34302/1855908-34302849.pdf?src-supplier=Jameco; ComponentLink2URL: https://datasheet.ciiva.com/132/product-132800.pdf?src-supplier=Digi-Key; ComponentLink2Description: https://datasheet.ciiva.com/132/product-132800.pdf?src-supplier=Digi-Key; ComponentLink3URL: https://datasheet.ciiva.com/132/grm1555c1h102ja01-01-132799.pdf?src-supplier=Digi-Key; ComponentLink3Description: https://datasheet.ciiva.com/132/grm1555c1h102ja01-01-132799.pdf?src-supplier=Digi-Key; ComponentLink4URL: https://datasheet.ciiva.com/11786/0900766b807a1cab-11786727.pdf?src-supplier=RSComponents; ComponentLink4Description: https://datasheet.ciiva.com/11786/0900766b807a1cab-11786727.pdf?src-supplier=RSComponents; ComponentLink5URL: https://datasheet.ciiva.com/29200/453569-da-01-en-vs-kondensator-0402-29200121.pdf?src-supplier=Conrad; ComponentLink5Description: https://datasheet.ciiva.com/29200/453569-da-01-en-vs-kondensator-0402-29200121.pdf?src-supplier=Conrad; ComponentLink6URL: https://datasheet.ciiva.com/7828/4360-7828821.pdf?src-supplier=Element14; ComponentLink6Description: https://datasheet.ciiva.com/7828/4360-7828821.pdf?src-supplier=Element14; ComponentLink7URL: https://datasheet.ciiva.com/14116/grmseries-tc-hitype-eng-14116919.pdf?src-supplier=Distrelec; ComponentLink7Description: https://datasheet.ciiva.com/14116/grmseries-tc-hitype-eng-14116919.pdf?src-supplier=Distrelec; ComponentLink8URL: https://datasheet.ciiva.com/14116/grmseries-tc-hitype-eng-14116858.pdf?src-supplier=Distrelec; ComponentLink8Description: https://datasheet.ciiva.com/14116/grmseries-tc-hitype-eng-14116858.pdf?src-supplier=Distrelec; ComponentLink9URL: https://datasheet.ciiva.com/132/grm1555c1h102ja01-01-132801.pdf?src-supplier=Digi-Key; ComponentLink9Description: https://datasheet.ciiva.com/132/grm1555c1h102ja01-01-132801.pdf?src-supplier=Digi-Key; ComponentLink10URL: https://datasheet.ciiva.com/7828/1747436-7828822.pdf?src-supplier=Element14; ComponentLink10Description: https://datasheet.ciiva.com/7828/1747436-7828822.pdf?src-supplier=Element14; Supplier Part Number 1: GRM1555C1H102JA01D; LCSC Part Number: C76947
C239 = CC0201KRX5R6BB104: as C151 on sheet RK3566_VO_SHEET_2; Supplier 1: Mouser; Manufacturer Part Number: CC0201KRX5R6BB104; RoHS: Yes; Category: Ceramic Capacitors; Stock 1: 824403; Pricing 1: 1=0.10000, 10=0.02400, 50=0.02400, 100=0.01900, 1000=0.01100, 10000=0.00900 (USD); Mount: Surface Mount; Case/Package: 0201; Case Code (Imperial): 0201; Case Code (Metric): 0603; Min Operating Temperature: -55°C; Max Operating Temperature: 85°C; Capacitance: 100nF; Dielectric: X5R; Packaging: Tape and Reel; Voltage Rating: 10V; Termination: SMD/SMT; Voltage Rating (DC): 10V; Series: CC; Length: 0.6mm; Width: 0.012inch; Height: 0.3mm; Depth: 0.3mm; Thickness: 0.013inch; Radiation Hardening: No; RoHS Compliant: Yes; Lead Free: Lead Free; Halogen Free: Halogen Free; ComponentLink1URL: https://datasheet.ciiva.com/11587/upy-gphc-x5r-4v-to-50v-12-11587190.pdf?src-supplier=Avnet; ComponentLink1Description: https://datasheet.ciiva.com/11587/upy-gphc-x5r-4v-to-50v-12-11587190.pdf?src-supplier=Avnet; Supplier Part Number 1: 603-CC201KRX5R6BB104; LCSC Part Number: C190183; Weight: 6E-06oz; Resistor Type: Ceramic; Construction: Flat
C254 = GRM1555C1H101JA01D: CAP CER 100PF 50V C0G/NP0 0402; Manufacturer: Murata; Material: Ceramic; Dielectric: C0G; Tolerance: 5%; Supplier 1: Mouser; Manufacturer Part Number: GRM1555C1H101JA01D; RoHS: Yes; Category: Ceramic Capacitors; Stock 1: 2073105; Pricing 1: 1=0.10000, 10=0.01000, 50=0.01000, 100=0.00900, 500=0.00600, 1000=0.00500, 2500=0.00400, 10000=0.00300, 50000=0.00200 (USD); Mount: Surface Mount; Case/Package: 0402; Case Code (Metric): 1005; Case Code (Imperial): 0402; Min Operating Temperature: -55°C; Max Operating Temperature: 125°C; Voltage Rating: 50V; Capacitance: 100pF; Packaging: Tape and Reel; Package Quantity: 1; Voltage Rating (DC): 50V; Termination: SMD/SMT; Series: GRM; Construction: Flat; Voltage: 50V; Length: 1mm; Width: 0.02inch; Height: 0.5mm; Thickness: 0.022inch; Depth: 0.5mm; Radiation Hardening: No; REACH SVHC: No SVHC; Lead Free: Lead Free; RoHS Compliant: Yes; ComponentLink1URL: https://datasheet.ciiva.com/11786/0900766b80ef921d-11786069.pdf?src-supplier=RSComponents; ComponentLink1Description: https://datasheet.ciiva.com/11786/0900766b80ef921d-11786069.pdf?src-supplier=RSComponents; ComponentLink2URL: https://datasheet.ciiva.com/18184/getdatasheetpartid-199957-18184175.pdf?src-supplier=Verical; ComponentLink2Description: https://datasheet.ciiva.com/18184/getdatasheetpartid-199957-18184175.pdf?src-supplier=Verical; ComponentLink3URL: https://datasheet.ciiva.com/29200/453557-da-01-en-vs-kondensator-0402-29200111.pdf?src-supplier=Conrad; ComponentLink3Description: https://datasheet.ciiva.com/29200/453557-da-01-en-vs-kondensator-0402-29200111.pdf?src-supplier=Conrad; ComponentLink4URL: https://datasheet.ciiva.com/6271/partnumbering-e-01-6271071.pdf?src-supplier=Digi-Key; ComponentLink4Description: https://datasheet.ciiva.com/6271/partnumbering-e-01-6271071.pdf?src-supplier=Digi-Key; ComponentLink5URL: https://datasheet.ciiva.com/16440/product-16440566.pdf?src-supplier=Future+Electronics; ComponentLink5Description: https://datasheet.ciiva.com/16440/product-16440566.pdf?src-supplier=Future+Electronics; Supplier Part Number 1: 81-GRM1555C1H101JA1D; LCSC Part Number: C77177
L10 = WPN4020H2R2MT: Fixed Ind 2.2UH 4.3A 48MOHM SMD; Manufacturer: Sunlord; Item Type: Inductor; Manufacturer Part Number: WPN4020H2R2MT; LCSC Part Number: C98361; ComponentLink1Description: LCSC; ComponentLink1URL: https://www.lcsc.com/product-detail/Power-Inductors_Sunlord-WPN4020H2R2MT_C98361.html; Supplier 1: Digi-Key; RoHS: No; Stock 1: 1762; Pricing 1: 1=0.84000, 10=0.73500, 25=0.68240, 50=0.57760, 100=0.52500, 250=0.49352, 500=0.44100, 1000=0.35700 (USD); Supplier Part Number 1: 3442-WPN4020H2R2MTCT-ND
R98 = RC0603JR-070RL: RES 0 OHM JUMPER 1/10W 0603; Manufacturer: Yageo; Item Type: Resistor; Resistance: 0mR; Tolerance: 1%; Power Rating: 100mW; Voltage Rating: 50V; Temperature Coefficient: 200ppm/°C; Resistance Tolerance: 5%; Supplier 1: Digi-Key; Manufacturer Part Number: RC0603JR-070RL; RoHS: Yes; Stock 1: 18081776; Pricing 1: 1=0.10000, 10=0.01700, 25=0.01240, 50=0.00960, 100=0.00700, 250=0.00536, 500=0.00430, 1000=0.00316 (USD); Case/Package: 0603; Contact Plating: Tin,Matte; Case Code (Imperial): 0603; Case Code (Metric): 1608; Size Code: 0603; Min Operating Temperature: -55°C; Max Operating Temperature: 155°C; Resistor Type: Thick Film; Packaging: Tape and Reel; Termination: SMD/SMT; Features: Moisture Resistant; Series: RC; Max Power Dissipation: 100mW; Number of Terminations: 2; Length: 1.6mm; Width: 0.8mm; Height: 0.45mm; Radiation Hardening: No; Lead Free: Lead Free; RoHS Compliant: Yes; Supplier Part Number 1: 311-0.0GRCT-ND; LCSC Part Number: C95177; Category: Chip SMD Resistors; Number of Pins: 2; Voltage Rating (DC): 50V; Technology: THICK FILM; Package Quantity: 5000; Construction: Rectangular; Depth: 0.8mm; Reach SVHC Compliant: No SVHC; Military Standard: Not
R99 = RC0402FR-0720KL: RES 20K OHM 1% 1/16W 0402; Manufacturer: Yageo; Resistance: 20kR; Temperature Coefficient: 100ppm/°C; Power Rating: 62.5mW; Voltage Rating: 50V; Max Power Dissipation: 63mW; Item Type: Resistor; Supplier 1: Avnet; Manufacturer Part Number: RC0402FR-0720KL; RoHS: Yes; Category: Chip SMD Resistors; Stock 1: 1960708; Pricing 1: 10000=0.00085 (USD); Case/Package: 0402; Case Code (Metric): 1005; Case Code (Imperial): 0402; Min Operating Temperature: -55°C; Max Operating Temperature: 155°C; Resistor Type: Thick Film; Tolerance: 1%; Packaging: Tape and Reel; Package Quantity: 1; Number of Terminations: 2; Termination: SMD/SMT; Features: Moisture Resistant; Series: RC; Resistance Tolerance: 1%; Construction: Rectangular; Technology: THICK FILM; Length: 1mm; Width: 0.02inch; Height: 0.016inch; Depth: 0.5mm; Lead Free: Lead Free; RoHS Compliant: Yes; Military Standard: Not; ComponentLink1URL: https://datasheet.ciiva.com/11808/0900766b80c66297-11808454.pdf?src-supplier=RSComponents; ComponentLink1Description: https://datasheet.ciiva.com/11808/0900766b80c66297-11808454.pdf?src-supplier=RSComponents; ComponentLink2URL: https://datasheet.ciiva.com/7983/1018594-7983511.pdf?src-supplier=Element14; ComponentLink2Description: https://datasheet.ciiva.com/7983/1018594-7983511.pdf?src-supplier=Element14; ComponentLink3URL: https://datasheet.ciiva.com/46394/1018594-46394974.pdf?src-supplier=Element14; ComponentLink3Description: https://datasheet.ciiva.com/46394/1018594-46394974.pdf?src-supplier=Element14; ComponentLink4URL: https://datasheet.ciiva.com/2453/pyu-r-int-thick-7-2453494.pdf?src-supplier=Digi-Key; ComponentLink4Description: https://datasheet.ciiva.com/2453/pyu-r-int-thick-7-2453494.pdf?src-supplier=Digi-Key; ComponentLink5URL: https://datasheet.ciiva.com/2453/pyu-r-int-thick-7-2453495.pdf?src-supplier=Digi-Key; ComponentLink5Description: https://datasheet.ciiva.com/2453/pyu-r-int-thick-7-2453495.pdf?src-supplier=Digi-Key; ComponentLink6URL: https://datasheet.ciiva.com/2453/pyu-r-int-thick-7-2453493.pdf?src-supplier=Digi-Key; ComponentLink6Description: https://datasheet.ciiva.com/2453/pyu-r-int-thick-7-2453493.pdf?src-supplier=Digi-Key; ComponentLink7URL: https://datasheet.ciiva.com/12558/pyu-rc0402-51-rohs-l-6-r-8721-12558796.pdf?src-supplier=Mouser; ComponentLink7Description: https://datasheet.ciiva.com/12558/pyu-rc0402-51-rohs-l-6-r-8721-12558796.pdf?src-supplier=Mouser; Supplier Part Number 1: RC0402FR-0720KL; LCSC Part Number: C93942; Number of Pins: 2; Size Code: 0402; Voltage Rating (DC): 50V; Reach SVHC Compliant: Yes
R100 = RC0402FR-072KL: RES 2K OHM 1% 1/16W 0402; Manufacturer: Yageo; Power Rating: 63mW; Temperature Coefficient: 100ppm/°C; Voltage Rating (DC): 50V; Item Type: Resistor; Value: 2kR; Manufacturer Part Number: RC0402FR-072KL; RoHS: Yes; Category: Chip SMD Resistors; Case/Package: 0402; Case Code (Metric): 1005; Case Code (Imperial): 0402; Min Operating Temperature: -55°C; Max Operating Temperature: 155°C; Package Quantity: 1; Packaging: Tape and Reel; Tolerance: 1%; Resistor Type: Thick Film; Number of Terminations: 2; Max Power Dissipation: 63mW; Features: Moisture Resistant; Series: RC; Construction: Rectangular; Length: 0.039inch; Width: 0.02inch; Height: 0.016inch; Depth: 0.5mm; Military Standard: Not; Lead Free: 5697LeadFree; RoHS Compliant: Yes; ComponentLink1URL: https://datasheet.ciiva.com/11808/0900766b80c66297-11808787.pdf?src-supplier=Rs; ComponentLink1Description: https://datasheet.ciiva.com/11808/0900766b80c66297-11808787.pdf?src-supplier=Rs; LCSC Part Number: C60488; ComponentLink2URL: https://datasheet.ciiva.com/11808/0900766b80c66297-11808787.pdf?src-supplier=Rs; ComponentLink2Description: https://datasheet.ciiva.com/11808/0900766b80c66297-11808787.pdf?src-supplier=Rs; ComponentLink3URL: https://datasheet.ciiva.com/7849/1018594-7849934.pdf?src-supplier=Element14; ComponentLink3Description: https://datasheet.ciiva.com/7849/1018594-7849934.pdf?src-supplier=Element14; ComponentLink4URL: https://datasheet.ciiva.com/7849/1018594-7849935.pdf?src-supplier=Element14; ComponentLink4Description: https://datasheet.ciiva.com/7849/1018594-7849935.pdf?src-supplier=Element14; ComponentLink5URL: https://datasheet.ciiva.com/7983/1018594-7983517.pdf?src-supplier=Element14; ComponentLink5Description: https://datasheet.ciiva.com/7983/1018594-7983517.pdf?src-supplier=Element14; ComponentLink6URL: https://datasheet.ciiva.com/2453/pyu-r-int-thick-7-2453635.pdf?src-supplier=Digi-Key; ComponentLink6Description: https://datasheet.ciiva.com/2453/pyu-r-int-thick-7-2453635.pdf?src-supplier=Digi-Key; ComponentLink7URL: https://datasheet.ciiva.com/2453/pyu-r-int-thick-7-2453636.pdf?src-supplier=Digi-Key; ComponentLink7Description: https://datasheet.ciiva.com/2453/pyu-r-int-thick-7-2453636.pdf?src-supplier=Digi-Key; ComponentLink8URL: https://datasheet.ciiva.com/2453/pyu-r-int-thick-7-2453634.pdf?src-supplier=Digi-Key; ComponentLink8Description: https://datasheet.ciiva.com/2453/pyu-r-int-thick-7-2453634.pdf?src-supplier=Digi-Key; ComponentLink9URL: https://datasheet.ciiva.com/12667/pyu-rc0402-51-rohs-l-6-r-12667451.pdf?src-supplier=Mouser; ComponentLink9Description: https://datasheet.ciiva.com/12667/pyu-rc0402-51-rohs-l-6-r-12667451.pdf?src-supplier=Mouser; ComponentLink10URL: https://datasheet.ciiva.com/15189/getdatasheetpartid-358921-15189414.pdf?src-supplier=Verical; ComponentLink10Description: https://datasheet.ciiva.com/15189/getdatasheetpartid-358921-15189414.pdf?src-supplier=Verical; Supplier: Future Electronics; Supplier Part Number: 7970452; Stock: 8530000; Pricing: 10000=0.0018, 100000=0.0011, 200000=0.0017, 300000=0.001, 750000=0.0016, 2000000=0.0009, 2500000=0.0016, 10000000=0.0014 (USD); Voltage Rating: 50V; Termination: SMD/SMT; Working Voltage: 50V; Technology: THICK FILM; Resistance Tolerance: 1%; Reach SVHC Compliant: Unknown; ComponentLink11URL: https://datasheet.ciiva.com/2453/pyu-r-int-thick-7-2453635.pdf?src-supplier=Digikey; ComponentLink11Description: https://datasheet.ciiva.com/2453/pyu-r-int-thick-7-2453635.pdf?src-supplier=Digikey; ComponentLink12URL: https://datasheet.ciiva.com/2453/pyu-r-int-thick-7-2453636.pdf?src-supplier=Digikey; ComponentLink12Description: https://datasheet.ciiva.com/2453/pyu-r-int-thick-7-2453636.pdf?src-supplier=Digikey; ComponentLink13URL: https://datasheet.ciiva.com/2453/pyu-r-int-thick-7-2453634.pdf?src-supplier=Digikey; ComponentLink13Description: https://datasheet.ciiva.com/2453/pyu-r-int-thick-7-2453634.pdf?src-supplier=Digikey
R101 = RT0402BRD07100KL: RES SMD 100K OHM 0.1% 1/16W 0402; Manufacturer: Yageo; Voltage Rating (DC): 50V; Item Type: Resistor; Supplier: Digikey; Supplier Part Number: YAG1343CT-ND; Manufacturer Part Number: RT0402BRD07100KL; RoHS: Yes; Category: Chip SMD Resistors; Stock: 62932; Pricing: 1=0.16, 10=0.121, 50=0.0958, 100=0.0859, 500=0.0654, 1000=0.0578, 5000=0.04283 (USD); ComponentLink1URL: https://datasheet.ciiva.com/12724/pyu-rt-1-to-0-05-rohs-l-4-12724954.pdf?src-supplier=Mouser; ComponentLink1Description: https://datasheet.ciiva.com/12724/pyu-rt-1-to-0-05-rohs-l-4-12724954.pdf?src-supplier=Mouser; LCSC Part Number: C852472
R102 R103 = RC0402FR-07240RL: RES 240 OHM 1% 1/16W 0402; Manufacturer: Yageo; Power Rating: 63mW; Temperature Coefficient: 100ppm/°C; Voltage Rating (DC): 50V; Supplier 1: Mouser; Manufacturer Part Number: RC0402FR-07240RL; RoHS: Yes; Category: Chip SMD Resistors; Stock 1: 1903202; Pricing 1: 1=0.10000, 10=0.01200, 50=0.01200, 100=0.00500, 1000=0.00300, 10000=0.00100 (USD); Case/Package: 0402; Case Code (Metric): 1005; Case Code (Imperial): 0402; Size Code: 0402; Min Operating Temperature: -55°C; Max Operating Temperature: 155°C; Resistance: 240R; Tolerance: 1%; Packaging: Tape and Reel; Resistor Type: Thick Film; Voltage Rating: 50V; Package Quantity: 1; Number of Terminations: 2; Termination: SMD/SMT; Max Power Dissipation: 63mW; Features: Moisture Resistant; Series: RC; Construction: Rectangular; Resistance Tolerance: 1%; Length: 1mm; Width: 0.02inch; Height: 0.016inch; Depth: 0.5mm; REACH SVHC: Unknown; Lead Free: Lead Free; RoHS Compliant: Yes; Military Standard: Not; ComponentLink1URL: https://datasheet.ciiva.com/7849/1018594-7849915.pdf?src-supplier=Element14; ComponentLink1Description: https://datasheet.ciiva.com/7849/1018594-7849915.pdf?src-supplier=Element14; ComponentLink2URL: https://datasheet.ciiva.com/7849/1018594-7849916.pdf?src-supplier=Element14; ComponentLink2Description: https://datasheet.ciiva.com/7849/1018594-7849916.pdf?src-supplier=Element14; ComponentLink3URL: https://datasheet.ciiva.com/2519/pyu-r-int-thick-7-2519157.pdf?src-supplier=Digi-Key; ComponentLink3Description: https://datasheet.ciiva.com/2519/pyu-r-int-thick-7-2519157.pdf?src-supplier=Digi-Key; ComponentLink4URL: https://datasheet.ciiva.com/2519/pyu-r-int-thick-7-2519158.pdf?src-supplier=Digi-Key; ComponentLink4Description: https://datasheet.ciiva.com/2519/pyu-r-int-thick-7-2519158.pdf?src-supplier=Digi-Key; ComponentLink5URL: https://datasheet.ciiva.com/2519/pyu-r-int-thick-7-2519156.pdf?src-supplier=Digi-Key; ComponentLink5Description: https://datasheet.ciiva.com/2519/pyu-r-int-thick-7-2519156.pdf?src-supplier=Digi-Key; ComponentLink6URL: https://datasheet.ciiva.com/12669/pyu-rc0402-51-rohs-l-6-r-12669689.pdf?src-supplier=Mouser; ComponentLink6Description: https://datasheet.ciiva.com/12669/pyu-rc0402-51-rohs-l-6-r-12669689.pdf?src-supplier=Mouser; ComponentLink7URL: https://datasheet.ciiva.com/17419/pyu-rc0402-51-rohs-l-6-r-17419482.pdf?src-supplier=Future+Electronics; ComponentLink7Description: https://datasheet.ciiva.com/17419/pyu-rc0402-51-rohs-l-6-r-17419482.pdf?src-supplier=Future+Electronics; Supplier Part Number 1: 603-RC0402FR-07240RL
R104 = RC0603JR-070RL: RES 0 OHM JUMPER 1/10W 0603; Manufacturer: Yageo; Resistance: 0mR; Tolerance: 1%; Power Rating: 100mW; Voltage Rating: 50V; Temperature Coefficient: 200ppm/°C; Resistance Tolerance: 5%; Item Type: Resistor; Supplier 1: Digi-Key; Manufacturer Part Number: RC0603JR-070RL; RoHS: Yes; Category: Chip SMD Resistors; Stock 1: 18081776; Pricing 1: 1=0.10000, 10=0.01700, 25=0.01240, 50=0.00960, 100=0.00700, 250=0.00536, 500=0.00430, 1000=0.00316 (USD); Case/Package: 0603; Contact Plating: Tin,Matte; Case Code (Imperial): 0603; Case Code (Metric): 1608; Size Code: 0603; Min Operating Temperature: -55°C; Max Operating Temperature: 155°C; Resistor Type: Thick Film; Packaging: Tape and Reel; Termination: SMD/SMT; Features: Moisture Resistant; Series: RC; Max Power Dissipation: 100mW; Number of Terminations: 2; Length: 1.6mm; Width: 0.8mm; Height: 0.45mm; Radiation Hardening: No; Lead Free: Lead Free; RoHS Compliant: Yes; Supplier Part Number 1: 311-0.0GRCT-ND; LCSC Part Number: C95177; Number of Pins: 2; Voltage Rating (DC): 50V; Technology: THICK FILM; Package Quantity: 5000; Construction: Rectangular; Depth: 0.8mm; Reach SVHC Compliant: No SVHC; Military Standard: Not
U11 = SY8089AAAC: Step-down type SOT-23-5 DC-DC Converters ROHS; Manufacturer: Silergy; Item Type: IC; Supplier 1: LCSC; Manufacturer Part Number: SY8089AAAC; RoHS: No; Supplier Part Number 1: C78988; LCSC Part Number: C78988; ComponentLink1Description: LCSC; ComponentLink1URL: https://www.lcsc.com/product-detail/DC-DC-Converters_Silergy-Corp-SY8089AAAC_C78988.html
U12 = K4U6E3S4AA-MGCL: FBGA-200 DDR SDRAM ROHS; Manufacturer: Samsung; Item Type: IC; Supplier: LCSC; LCSC Part Number: C2920249; Manufacturer Part Number: K4U6E3S4AA-MGCL; RoHS: No; Stock: 962; Pricing: 1=9.1076, 10=7.9029, 30=7.1674, 128=6.5516 (USD)